# Altium schematic sheet Controller-Sheet.SchDoc
size A4; SheetNumber: 4; SheetTotal: 10
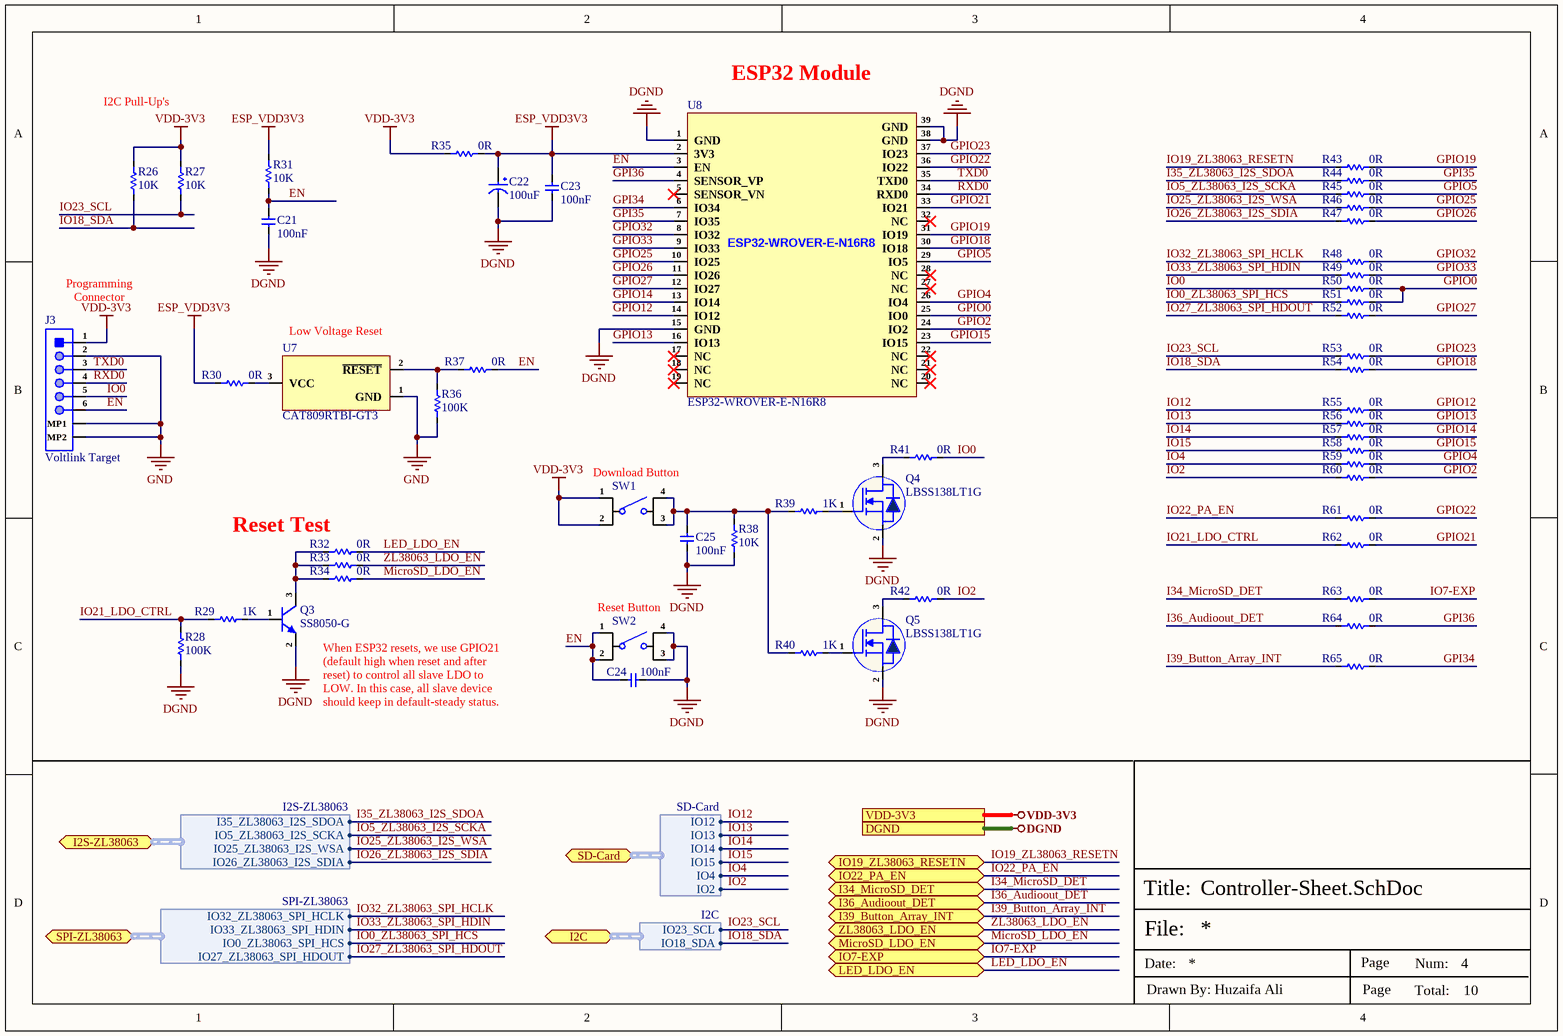
[diagram p0: Controller-Sheet.SchDoc]

## Parts
C21  100nF  [Cap-0402]
C22  100uF  [Case-E]
C23  100nF  [Cap-0402]
C24  100nF  [Cap-0402]
C25  100nF  [Cap-0402]
J3  Voltlink Target  [Voltlink Target]
Q3  SS8050-G  [SOT-23]
Q4  LBSS138LT1G  [SOT-23]
Q5  LBSS138LT1G  [SOT-23]
R26  10K  [Res-0402]
R27  10K  [Res-0402]
R28  100K  [Res-0402]
R29  1K  [Res-0402]
R30  0R  [Res-0201]
R31  10K  [Res-0402]
R32  0R  [Res-0201]
R33  0R  [Res-0201]
R34  0R  [Res-0201]
R35  0R  [Res-0603]
R36  100K  [Res-0402]
R37  0R  [Res-0201]
R38  10K  [Res-0402]
R39  1K  [Res-0402]
R40  1K  [Res-0402]
R41  0R  [Res-0201]
R42  0R  [Res-0201]
R43  0R  [Res-0201]
R44  0R  [Res-0201]
R45  0R  [Res-0201]
R46  0R  [Res-0201]
R47  0R  [Res-0201]
R48  0R  [Res-0201]
R49  0R  [Res-0201]
R50  0R  [Res-0201]
R51  0R  [Res-0201]
R52  0R  [Res-0201]
R53  0R  [Res-0201]
R54  0R  [Res-0201]
R55  0R  [Res-0201]
R56  0R  [Res-0201]
R57  0R  [Res-0201]
R58  0R  [Res-0201]
R59  0R  [Res-0201]
R60  0R  [Res-0201]
R61  0R  [Res-0201]
R62  0R  [Res-0201]
R63  0R  [Res-0201]
R64  0R  [Res-0201]
R65  0R  [Res-0201]
SW1  TS-1109S-C-B  [TS-1109S-C-B]  (value not drawn)
SW2  TS-1109S-C-B  [TS-1109S-C-B]  (value not drawn)
U7  CAT809RTBI-GT3  [SOT-23]
U8  ESP32-WROVER-E-N16R8  [ESP32-WROVER-E-N16R8]

## Ports
DGND (see Top-Sheet[2A], Buttons-LED-Sheet[3D], MICs-Sheet[3D], Power-Sheet[2D], SD-Card-Sheet[3D]), I2C (bidir, harness I2C, see Top-Sheet[3C], Buttons-LED-Sheet[2D]), I2S-ZL38063 (bidir, harness I2S-ZL38063, see Top-Sheet[3A], DSP-Sheet-2[1D]), I34_MicroSD_DET (bidir, see Top-Sheet[2C], SD-Card-Sheet[2D]), I36_Audioout_DET (bidir, see Top-Sheet[3B], Amplifier-Sheet[2D]), I39_Button_Array_INT (bidir, see Top-Sheet[3C], Buttons-LED-Sheet[2D]), IO7-EXP (bidir, see Top-Sheet[3C], Buttons-LED-Sheet[2D]), IO19_ZL38063_RESETN (bidir, see Top-Sheet[3A], DSP-Sheet-2[2D]), IO22_PA_EN (bidir, see Top-Sheet[3B], Amplifier-Sheet[2D]), LED_LDO_EN (bidir, see Top-Sheet[3C], Buttons-LED-Sheet[2D]), MicroSD_LDO_EN (bidir, see Top-Sheet[2B], Power-Sheet[1D]), SD-Card (bidir, harness SD-Card, see Top-Sheet[2C], SD-Card-Sheet[1D]), SPI-ZL38063 (bidir, harness SPI-ZL38063, see Top-Sheet[3A], DSP-Sheet-2[1D]), VDD-3V3 (see Top-Sheet[2A], Buttons-LED-Sheet[3D], Power-Sheet[2D]), ZL38063_LDO_EN (bidir, see Top-Sheet[2B], Power-Sheet[1D])

## Harnesses
I2S-ZL38063: I35_ZL38063_I2S_SDOA, IO5_ZL38063_I2S_SCKA, IO25_ZL38063_I2S_WSA, IO26_ZL38063_I2S_SDIA
SPI-ZL38063: IO32_ZL38063_SPI_HCLK, IO33_ZL38063_SPI_HDIN, IO0_ZL38063_SPI_HCS, IO27_ZL38063_SPI_HDOUT
I2C: IO23_SCL, IO18_SDA
SD-Card: IO12, IO13, IO14, IO15, IO4, IO2

## Nets
DGND: C21.1 C22.2 C23.1 C24.1 C25.1 Q3.2(E) Q4.2(S) Q5.2(S) R28.1 R38.1 SW2.3 SW2.4 U8.1(GND) U8.15(GND) U8.38(GND) U8.39(GND) ; port DGND
ESP_VDD3V3: C22.1 C23.2 R30.1 R31.2 R35.2 U8.2(3V3)
GND: J3.2 J3.MP1 J3.MP2 R36.1 U7.1(GND)
VDD-3V3: J3.1 R26.2 R27.2 R35.1 SW1.1 SW1.2 ; port VDD-3V3
EN: C21.2 C24.2 J3.6 R31.1 R37.2 SW2.1 SW2.2 U8.3(EN)
GPI34: R65.2 U8.6(IO34)
GPI35: R44.2 U8.7(IO35)
GPI36: R64.2 U8.4(SENSOR_VP)
GPIO0: R50.2 R51.2 U8.25(IO0)
GPIO2: R60.2 U8.24(IO2)
GPIO4: R59.2 U8.26(IO4)
GPIO5: R45.2 U8.29(IO5)
GPIO12: R55.2 U8.14(IO12)
GPIO13: R56.2 U8.16(IO13)
GPIO14: R57.2 U8.13(IO14)
GPIO15: R58.2 U8.23(IO15)
GPIO18: R54.2 U8.30(IO18)
GPIO19: R43.2 U8.31(IO19)
GPIO21: R62.2 U8.33(IO21)
GPIO22: R61.2 U8.36(IO22)
GPIO23: R53.2 U8.37(IO23)
GPIO25: R46.2 U8.10(IO25)
GPIO26: R47.2 U8.11(IO26)
GPIO27: R52.2 U8.12(IO27)
GPIO32: R48.2 U8.8(IO32)
GPIO33: R49.2 U8.9(IO33)
I34_MicroSD_DET: R63.1 ; port I34_MicroSD_DET
I35_ZL38063_I2S_SDOA: R44.1 ; port I2S-ZL38063.I35_ZL38063_I2S_SDOA
I36_Audioout_DET: R64.1 ; port I36_Audioout_DET
I39_Button_Array_INT: R65.1 ; port I39_Button_Array_INT
IO0: J3.5 R41.2 R50.1
IO0_ZL38063_SPI_HCS: R51.1 ; port SPI-ZL38063.IO0_ZL38063_SPI_HCS
IO2: R42.2 R60.1 ; port SD-Card.IO2
IO4: R59.1 ; port SD-Card.IO4
IO5_ZL38063_I2S_SCKA: R45.1 ; port I2S-ZL38063.IO5_ZL38063_I2S_SCKA
IO7-EXP: R63.2 ; port IO7-EXP
IO12: R55.1 ; port SD-Card.IO12
IO13: R56.1 ; port SD-Card.IO13
IO14: R57.1 ; port SD-Card.IO14
IO15: R58.1 ; port SD-Card.IO15
IO18_SDA: R26.1 R54.1 ; port I2C.IO18_SDA
IO19_ZL38063_RESETN: R43.1 ; port IO19_ZL38063_RESETN
IO21_LDO_CTRL: R28.2 R29.2 R62.1
IO22_PA_EN: R61.1 ; port IO22_PA_EN
IO23_SCL: R27.1 R53.1 ; port I2C.IO23_SCL
IO25_ZL38063_I2S_WSA: R46.1 ; port I2S-ZL38063.IO25_ZL38063_I2S_WSA
IO26_ZL38063_I2S_SDIA: R47.1 ; port I2S-ZL38063.IO26_ZL38063_I2S_SDIA
IO27_ZL38063_SPI_HDOUT: R52.1 ; port SPI-ZL38063.IO27_ZL38063_SPI_HDOUT
IO32_ZL38063_SPI_HCLK: R48.1 ; port SPI-ZL38063.IO32_ZL38063_SPI_HCLK
IO33_ZL38063_SPI_HDIN: R49.1 ; port SPI-ZL38063.IO33_ZL38063_SPI_HDIN
LED_LDO_EN: R32.2 ; port LED_LDO_EN
MicroSD_LDO_EN: R34.2 ; port MicroSD_LDO_EN
RXD0: J3.4 U8.34(RXD0)
TXD0: J3.3 U8.35(TXD0)
ZL38063_LDO_EN: R33.2 ; port ZL38063_LDO_EN
NetC25_2: C25.2 R38.2 R39.2 R40.2 SW1.3 SW1.4
NetQ3_1: Q3.1(B) R29.1
NetQ3_3: Q3.3(C) R32.1 R33.1 R34.1
NetQ4_1: Q4.1(G) R39.1
NetQ4_3: Q4.3(D) R41.1
NetQ5_1: Q5.1(G) R40.1
NetQ5_3: Q5.3(D) R42.1
NetR30_2: R30.2 U7.3(VCC)
NetR36_2: R36.2 R37.1 U7.2(~{RESET})

Not connected (* = marked no-connect by the designer): U8 5(SENSOR_VN)* 17(NC)* 18(NC)* 19(NC)* 20(NC)* 21(NC)* 22(NC)* 27(NC)* 28(NC)* 32(NC)*

## Notes on the sheet
- I2C Pull-Up's
- (near U8) ESP32 Module
- (near J3) Programming Connector
- (near U7) Low Voltage Reset
- (near R32) Reset Test
- (near SW1) Download Button
- (near SW2) Reset Button
- (near Q3) When ESP32 resets, we use GPIO21 (default high when reset and after reset) to control all slave LDO to LOW. In this case, all slave device should keep in default-steady status.
- File:
- Title:
- Date:
- Page
- Num:
- Total:
- Drawn By: Huzaifa Ali

## Library data of the parts
C21 C23-C25 = CC0402KRX5R7BB104: CAP CER 0.1UF 16V X5R 0402; Manufacturer: Yageo; Tolerance: 10%; Supplier 1: Mouser; Manufacturer Part Number: CC0402KRX5R7BB104; RoHS: Yes; Category: Ceramic Capacitors; Stock 1: 936792; Pricing 1: 1=0.10000, 10=0.02300, 50=0.02300, 100=0.01100, 1000=0.00600, 10000=0.00400 (USD); Mount: Surface Mount; Case/Package: 0402; Number of Pins: 2; Case Code (Metric): 1005; Case Code (Imperial): 0402; Min Operating Temperature: -55°C; Max Operating Temperature: 85°C; Capacitance: 100nF; Dielectric: X5R; Packaging: Tape and Reel; Voltage Rating: 16V; Package Quantity: 1; Voltage Rating (DC): 16V; Termination: SMD/SMT; Resistor Type: Ceramic; Series: CC; Construction: Flat; Length: 1mm; Width: 0.02inch; Height: 0.5mm; Thickness: 0.022inch; Depth: 0.5mm; Radiation Hardening: No; REACH SVHC: Unknown; Lead Free: Lead Free; Halogen Free: Halogen Free; RoHS Compliant: Yes; ComponentLink1URL: https://datasheet.ciiva.com/155/mlccorderingcode-155879.pdf?src-supplier=Digi-Key; ComponentLink1Description: https://datasheet.ciiva.com/155/mlccorderingcode-155879.pdf?src-supplier=Digi-Key; ComponentLink2URL: https://datasheet.ciiva.com/155/mlccorderingcode-155878.pdf?src-supplier=Digi-Key; ComponentLink2Description: https://datasheet.ciiva.com/155/mlccorderingcode-155878.pdf?src-supplier=Digi-Key; ComponentLink3URL: https://datasheet.ciiva.com/155/mlccorderingcode-155880.pdf?src-supplier=Digi-Key; ComponentLink3Description: https://datasheet.ciiva.com/155/mlccorderingcode-155880.pdf?src-supplier=Digi-Key; ComponentLink4URL: https://datasheet.ciiva.com/11464/upy-gphc-x5r-4v-to-50v-12-11464869.pdf?src-supplier=Avnet; ComponentLink4Description: https://datasheet.ciiva.com/11464/upy-gphc-x5r-4v-to-50v-12-11464869.pdf?src-supplier=Avnet; Supplier Part Number 1: 603-CC402KRX5R7BB104; LCSC Part Number: C106204
C22 = TAJE107M025RNJ: CAP TANT 100UF 20% 25V 2917; Manufacturer: Kyocera AVX; ESR (Equivalent Series Resistance): 300mR; Leakage Current: 25uA; Polarity: Polar; Dissipation Factor: 10%; Supplier 1: Mouser; Manufacturer Part Number: TAJE107M025RNJ; RoHS: Yes; Category: Tantalum Capacitors; Stock 1: 109; Pricing 1: 1=2.81000, 10=2.81000, 50=2.81000, 100=2.19000, 1000=1.76000, 10000=1.76000 (USD); Mount: Surface Mount; Case/Package: 2917; Number of Pins: 2; Case Code (Imperial): 2917; Case Code (Metric): 7343; Min Operating Temperature: -55°C; Max Operating Temperature: 125°C; Capacitance: 100uF; Tolerance: 20%; Packaging: Tape and Reel; Voltage Rating: 25V; Voltage Rating (DC): 25V; Features: General Purpose; Package Quantity: 1; Termination: SMD/SMT; Series: TAJ; Construction: Flat; Length: 7.3mm; Width: 4.3mm; Height: 4.3mm; Depth: 4.3mm; Height - Seated (Max): 0.169inch; Radiation Hardening: No; Lead Free: Lead Free; RoHS Compliant: Yes; REACH SVHC: No SVHC; ComponentLink1URL: https://datasheet.ciiva.com/26787/taje107m025rnj-26787048.pdf?src-supplier=IIIC; ComponentLink1Description: https://datasheet.ciiva.com/26787/taje107m025rnj-26787048.pdf?src-supplier=IIIC; ComponentLink2URL: https://datasheet.ciiva.com/265/taj-265541.pdf?src-supplier=Digi-Key; ComponentLink2Description: https://datasheet.ciiva.com/265/taj-265541.pdf?src-supplier=Digi-Key; ComponentLink3URL: https://datasheet.ciiva.com/265/taj-265542.pdf?src-supplier=Digi-Key; ComponentLink3Description: https://datasheet.ciiva.com/265/taj-265542.pdf?src-supplier=Digi-Key; ComponentLink4URL: https://datasheet.ciiva.com/265/taj-265540.pdf?src-supplier=Digi-Key; ComponentLink4Description: https://datasheet.ciiva.com/265/taj-265540.pdf?src-supplier=Digi-Key; ComponentLink5URL: https://datasheet.ciiva.com/28609/1719052-28609254.pdf?src-supplier=Element14; ComponentLink5Description: https://datasheet.ciiva.com/28609/1719052-28609254.pdf?src-supplier=Element14; ComponentLink6URL: https://datasheet.ciiva.com/11230/taj-11230456.pdf?src-supplier=Avnet; ComponentLink6Description: https://datasheet.ciiva.com/11230/taj-11230456.pdf?src-supplier=Avnet; ComponentLink7URL: https://datasheet.ciiva.com/17339/taj-17339677.pdf?src-supplier=Avnet+Europe; ComponentLink7Description: https://datasheet.ciiva.com/17339/taj-17339677.pdf?src-supplier=Avnet+Europe; ComponentLink8URL: https://datasheet.ciiva.com/22667/1719052-22667581.pdf?src-supplier=Element14; ComponentLink8Description: https://datasheet.ciiva.com/22667/1719052-22667581.pdf?src-supplier=Element14; Supplier Part Number 1: 581-TAJE107M025RNJ; LCSC Part Number: C7230
J3 = C145963: 1x6P SH 1 1mm 6 SMD,P=1mm Wire To Board / Wire To Wire Connector ROHS; Manufacturer: BOOMELE; Manufacturer Part Number: C145963; Package: SMD,P=1mm; LCSC Part Number: C145963; Item Type: Connector; ComponentLink1Description: LCSC; ComponentLink1URL: https://www.lcsc.com/product-detail/Wire-To-Board-Wire-To-Wire-Connector_BOOMELE-Boom-Precision-Elec-C145963_C145963.html
Q3 = SS8050-G: 25V 300mW 120@100mA,1V 1.5A NPN SOT-23 Bipolar Transistors - BJT ROHS; Manufacturer: Jiangsu Changjing Electronics Technology; Manufacturer Part Number: SS8050-G; Package: SOT-23; LCSC Part Number: C164886; Itype Type: Transistor; ComponentLink1Description: LCSC; ComponentLink1URL: https://www.lcsc.com/product-detail/Bipolar-Transistors-BJT_Jiangsu-Changjing-Electronics-Technology-Co-Ltd-SS8050-G_C164886.html
Q4 Q5 = LBSS138LT1G: 50V 0.2A 225mW 3.5Ω@5V,200mA N Channel SOT-23 MOSFETs ROHS; Manufacturer: LRC; Item Type: Mosfet; Manufacturer Part Number: LBSS138LT1G; Package: SOT-23; LCSC Part Number: C8490; ComponentLink1Description: LCSC; ComponentLink1URL: https://www.lcsc.com/product-detail/MOSFETs_LRC-LBSS138LT1G_C8490.html
R26 R27 R31 R38 = RC0402FR-0710KL: RES 10K OHM 1% 1/16W 0402; Manufacturer: Yageo; Resistance: 10kR; Voltage Rating (DC): 50V; Temperature Coefficient: 100ppm/°C; Power Rating: 62.5mW; Max Power Dissipation: 63mW; Item Type: Resistor; Supplier 1: Mouser; Manufacturer Part Number: RC0402FR-0710KL; RoHS: Yes; Category: Chip SMD Resistors; Stock 1: 18648329; Pricing 1: 1=0.10000, 10=0.01400, 50=0.01400, 100=0.00500, 1000=0.00300, 10000=0.00200 (USD); Case/Package: 0402; Number of Pins: 2; Case Code (Imperial): 0402; Case Code (Metric): 1005; Min Operating Temperature: -55°C; Max Operating Temperature: 155°C; Resistor Type: Thick Film; Tolerance: 1%; Packaging: Tape and Reel; Voltage Rating: 50V; Termination: SMD/SMT; Working Voltage: 50V; Number of Terminations: 2; Features: Moisture Resistant; Series: RC; Resistance Tolerance: 1%; Construction: Rectangular; Length: 1mm; Width: 0.5mm; Height: 0.32mm; Depth: 0.5mm; Lead Pitch: 0.2mm; REACH SVHC: No SVHC; Lead Free: Lead Free; RoHS Compliant: Yes; Military Standard: Not; ComponentLink1URL: https://datasheet.ciiva.com/7660/38568-7660787.pdf?src-supplier=Element14; ComponentLink1Description: https://datasheet.ciiva.com/7660/38568-7660787.pdf?src-supplier=Element14; ComponentLink2URL: https://datasheet.ciiva.com/7849/1686128-7849814.pdf?src-supplier=Element14; ComponentLink2Description: https://datasheet.ciiva.com/7849/1686128-7849814.pdf?src-supplier=Element14; ComponentLink3URL: https://datasheet.ciiva.com/7983/1018594-7983486.pdf?src-supplier=Element14; ComponentLink3Description: https://datasheet.ciiva.com/7983/1018594-7983486.pdf?src-supplier=Element14; ComponentLink4URL: https://datasheet.ciiva.com/22747/1018594-22747512.pdf?src-supplier=Element14; ComponentLink4Description: https://datasheet.ciiva.com/22747/1018594-22747512.pdf?src-supplier=Element14; ComponentLink5URL: https://datasheet.ciiva.com/12667/pyu-rc0402-51-rohs-l-6-r-12667067.pdf?src-supplier=Mouser; ComponentLink5Description: https://datasheet.ciiva.com/12667/pyu-rc0402-51-rohs-l-6-r-12667067.pdf?src-supplier=Mouser; ComponentLink6URL: https://datasheet.ciiva.com/7849/1784430-7849813.pdf?src-supplier=Element14; ComponentLink6Description: https://datasheet.ciiva.com/7849/1784430-7849813.pdf?src-supplier=Element14; ComponentLink7URL: https://datasheet.ciiva.com/7849/1784430-7849815.pdf?src-supplier=Element14; ComponentLink7Description: https://datasheet.ciiva.com/7849/1784430-7849815.pdf?src-supplier=Element14; Supplier Part Number 1: 603-RC0402FR-0710KL; LCSC Part Number: C60490
R28 R36 = RC0402FR-07100KL: RES 100K OHM 1% 1/16W 0402; Manufacturer: Yageo; Resistance: 100kR; Temperature Coefficient: 100ppm/°C; Power Rating: 63mW; Voltage Rating: 50V; Item Type: Resistor; Supplier 1: Mouser; Manufacturer Part Number: RC0402FR-07100KL; RoHS: Yes; Category: Chip SMD Resistors; Stock 1: 7759549; Pricing 1: 1=0.10000, 10=0.01200, 50=0.01200, 100=0.00500, 1000=0.00300, 2500=0.00200, 10000=0.00100 (USD); Case/Package: 0402; Case Code (Metric): 1005; Case Code (Imperial): 0402; Min Operating Temperature: -55°C; Max Operating Temperature: 155°C; Resistor Type: Thick Film; Tolerance: 1%; Packaging: Tape and Reel; Package Quantity: 1; Number of Terminations: 2; Termination: SMD/SMT; Max Power Dissipation: 63mW; Working Voltage: 50V; Features: Moisture Resistant; Series: RC; Resistance Tolerance: 1%; Construction: Rectangular; Technology: THICK FILM; Length: 0.039inch; Width: 0.02inch; Height: 0.016inch; Depth: 0.5mm; REACH SVHC: No SVHC; Lead Free: Lead Free; RoHS Compliant: Yes; Military Standard: Not; ComponentLink1URL: https://datasheet.ciiva.com/11819/0900766b80c66297-11819452.pdf?src-supplier=RSComponents; ComponentLink1Description: https://datasheet.ciiva.com/11819/0900766b80c66297-11819452.pdf?src-supplier=RSComponents; ComponentLink2URL: https://datasheet.ciiva.com/22747/1018594-22747509.pdf?src-supplier=Element14; ComponentLink2Description: https://datasheet.ciiva.com/22747/1018594-22747509.pdf?src-supplier=Element14; ComponentLink3URL: https://datasheet.ciiva.com/2453/pyu-r-int-thick-7-2453362.pdf?src-supplier=Digi-Key; ComponentLink3Description: https://datasheet.ciiva.com/2453/pyu-r-int-thick-7-2453362.pdf?src-supplier=Digi-Key; ComponentLink4URL: https://datasheet.ciiva.com/2453/pyu-r-int-thick-7-2453363.pdf?src-supplier=Digi-Key; ComponentLink4Description: https://datasheet.ciiva.com/2453/pyu-r-int-thick-7-2453363.pdf?src-supplier=Digi-Key; ComponentLink5URL: https://datasheet.ciiva.com/2453/pyu-r-int-thick-7-2453361.pdf?src-supplier=Digi-Key; ComponentLink5Description: https://datasheet.ciiva.com/2453/pyu-r-int-thick-7-2453361.pdf?src-supplier=Digi-Key; ComponentLink6URL: https://datasheet.ciiva.com/12667/pyu-rc0402-51-rohs-l-6-r-12667930.pdf?src-supplier=Mouser; ComponentLink6Description: https://datasheet.ciiva.com/12667/pyu-rc0402-51-rohs-l-6-r-12667930.pdf?src-supplier=Mouser; ComponentLink7URL: https://datasheet.ciiva.com/15189/getdatasheetpartid-323696-15189334.pdf?src-supplier=Verical; ComponentLink7Description: https://datasheet.ciiva.com/15189/getdatasheetpartid-323696-15189334.pdf?src-supplier=Verical; Supplier Part Number 1: 603-RC0402FR-07100KL; LCSC Part Number: C60491
R29 R39 R40 = RC0402FR-071KL: RES 1K OHM 1% 1/16W 0402; Manufacturer: Yageo; Resistance: 1kR; Temperature Coefficient: 100ppm/°C; Voltage Rating (DC): 50V; Power Rating: 62.5mW; Max Power Dissipation: 63mW; Item Type: Resistor; Supplier 1: Avnet; Manufacturer Part Number: RC0402FR-071KL; RoHS: Yes; Category: Chip SMD Resistors; Stock 1: 13030000; Pricing 1: 10000=0.00085, 20000=0.00087, 40000=0.00084, 60000=0.00083, 80000=0.00079, 100000=0.00078, 1000000=0.00076 (USD); Case/Package: 0402; Number of Pins: 2; Case Code (Imperial): 0402; Case Code (Metric): 1005; Size Code: 0402; Min Operating Temperature: -55°C; Max Operating Temperature: 155°C; Resistor Type: Thick Film; Tolerance: 1%; Packaging: Tape and Reel; Voltage Rating: 50V; Termination: SMD/SMT; Features: Moisture Resistant; Series: RC; Number of Terminations: 2; Resistance Tolerance: 1%; Construction: Rectangular; Technology: THICK FILM; Length: 1mm; Width: 0.5mm; Height: 0.32mm; Depth: 0.5mm; Reach SVHC Compliant: Yes; Lead Free: Lead Free; RoHS Compliant: Yes; Military Standard: Not; ComponentLink1URL: https://datasheet.ciiva.com/11819/0900766b80c66297-11819477.pdf?src-supplier=RSComponents; ComponentLink1Description: https://datasheet.ciiva.com/11819/0900766b80c66297-11819477.pdf?src-supplier=RSComponents; ComponentLink2URL: https://datasheet.ciiva.com/7983/1018594-7983502.pdf?src-supplier=Element14; ComponentLink2Description: https://datasheet.ciiva.com/7983/1018594-7983502.pdf?src-supplier=Element14; ComponentLink3URL: https://datasheet.ciiva.com/22747/1018594-22747513.pdf?src-supplier=Element14; ComponentLink3Description: https://datasheet.ciiva.com/22747/1018594-22747513.pdf?src-supplier=Element14; ComponentLink4URL: https://datasheet.ciiva.com/12666/pyu-rc0402-51-rohs-l-6-r-12666741.pdf?src-supplier=Mouser; ComponentLink4Description: https://datasheet.ciiva.com/12666/pyu-rc0402-51-rohs-l-6-r-12666741.pdf?src-supplier=Mouser; ComponentLink5URL: https://datasheet.ciiva.com/7849/1018594-7849869.pdf?src-supplier=Element14; ComponentLink5Description: https://datasheet.ciiva.com/7849/1018594-7849869.pdf?src-supplier=Element14; ComponentLink6URL: https://datasheet.ciiva.com/7849/1018594-7849871.pdf?src-supplier=Element14; ComponentLink6Description: https://datasheet.ciiva.com/7849/1018594-7849871.pdf?src-supplier=Element14; ComponentLink7URL: https://datasheet.ciiva.com/17063/pyu-rc0402-51-rohs-l-6-r-17063193.pdf?src-supplier=Future+Electronics; ComponentLink7Description: https://datasheet.ciiva.com/17063/pyu-rc0402-51-rohs-l-6-r-17063193.pdf?src-supplier=Future+Electronics; Supplier Part Number 1: RC0402FR-071KL; LCSC Part Number: C106235
R30 R32-R34 R37 R41-R65 = RC0201JR-070RL: RES SMD 0 OHM JUMPER 1/20W 0201; Manufacturer: Yageo; Power Rating: 50mW; Tolerance: 5%; Voltage Rating: 25V; Supplier 1: Digi-Key; Manufacturer Part Number: RC0201JR-070RL; RoHS: Yes; Category: Chip SMD Resistors; Stock 1: 11079; Pricing 1: 1=0.10000, 10=0.03600, 25=0.02640, 50=0.02000, 100=0.01480, 250=0.01128, 500=0.00904, 1000=0.00665, 5000=0.00477 (USD); Case/Package: 0201; Contact Plating: Tin,Matte; Case Code (Metric): 0603; Case Code (Imperial): 0201; Weight: 6E-06oz; Size Code: 0201; Min Operating Temperature: -55°C; Max Operating Temperature: 125°C; Resistor Type: Thick Film; Resistance: 0R; Packaging: Tape and Reel; Package Quantity: 10000; Number of Terminations: 2; Termination: SMD/SMT; Max Power Dissipation: 50mW; Voltage Rating (DC): 25V; Features: Moisture Resistant; Series: RC; Construction: Rectangular; Resistance Tolerance: 5%; Length: 0.6mm; Width: 0.012inch; Height: 0.01inch; Depth: 0.3mm; Radiation Hardening: No; RoHS Compliant: Yes; REACH SVHC: Unknown; Military Standard: Not; Lead Free: Lead Free; ComponentLink1URL: https://datasheet.ciiva.com/7672/1563626-7672247.pdf?src-supplier=Element14; ComponentLink1Description: https://datasheet.ciiva.com/7672/1563626-7672247.pdf?src-supplier=Element14; ComponentLink2URL: https://datasheet.ciiva.com/7660/1421516-7660808.pdf?src-supplier=Element14; ComponentLink2Description: https://datasheet.ciiva.com/7660/1421516-7660808.pdf?src-supplier=Element14; ComponentLink3URL: https://datasheet.ciiva.com/7672/1563626-7672248.pdf?src-supplier=Element14; ComponentLink3Description: https://datasheet.ciiva.com/7672/1563626-7672248.pdf?src-supplier=Element14; ComponentLink4URL: https://datasheet.ciiva.com/16855/pyu-rc0201-51-rohs-l-8-16855994.pdf?src-supplier=Avnet+Europe; ComponentLink4Description: https://datasheet.ciiva.com/16855/pyu-rc0201-51-rohs-l-8-16855994.pdf?src-supplier=Avnet+Europe; ComponentLink5URL: https://datasheet.ciiva.com/28419/pyu-rc0201-51-rohs-l-8-28419660.pdf?src-supplier=Avnet+Europe; ComponentLink5Description: https://datasheet.ciiva.com/28419/pyu-rc0201-51-rohs-l-8-28419660.pdf?src-supplier=Avnet+Europe; ComponentLink6URL: https://datasheet.ciiva.com/46391/1421516-46391340.pdf?src-supplier=Element14; ComponentLink6Description: https://datasheet.ciiva.com/46391/1421516-46391340.pdf?src-supplier=Element14; ComponentLink7URL: https://datasheet.ciiva.com/8896/pyu-rc0201-51-rohs-l-8-8896143.pdf?src-supplier=Avnet; ComponentLink7Description: https://datasheet.ciiva.com/8896/pyu-rc0201-51-rohs-l-8-8896143.pdf?src-supplier=Avnet; Supplier Part Number 1: 311-0.0NCT-ND; LCSC Part Number: C106228
R35 = RC0603JR-070RL: RES 0 OHM JUMPER 1/10W 0603; Manufacturer: Yageo; Resistance: 0mR; Tolerance: 1%; Power Rating: 100mW; Voltage Rating (DC): 50V; Temperature Coefficient: 200ppm/°C; Resistance Tolerance: 5%; Item Type: Resistor; Supplier 1: Digi-Key; Manufacturer Part Number: RC0603JR-070RL; RoHS: Yes; Category: Chip SMD Resistors; Stock 1: 18081776; Pricing 1: 1=0.10000, 10=0.01700, 25=0.01240, 50=0.00960, 100=0.00700, 250=0.00536, 500=0.00430, 1000=0.00316 (USD); Case/Package: 0603; Number of Pins: 2; Contact Plating: Tin,Matte; Case Code (Imperial): 0603; Case Code (Metric): 1608; Size Code: 0603; Min Operating Temperature: -55°C; Max Operating Temperature: 155°C; Resistor Type: Thick Film; Packaging: Tape and Reel; Termination: SMD/SMT; Series: RC; Technology: THICK FILM; Package Quantity: 5000; Voltage Rating: 50V; Features: Moisture Resistant; Max Power Dissipation: 100mW; Number of Terminations: 2; Construction: Rectangular; Length: 1.6mm; Width: 0.8mm; Height: 0.45mm; Depth: 0.8mm; Radiation Hardening: No; Reach SVHC Compliant: No SVHC; Lead Free: Lead Free; RoHS Compliant: Yes; Military Standard: Not; Supplier Part Number 1: 311-0.0GRCT-ND; LCSC Part Number: C95177
SW1 SW2 = TS-1109S-C-B: No NO 50mA 4.5mm 100000 260gf 12V -30℃~+85℃ 4.5mm 4.3mm Black Round Button Brick nogging SPST SMD Tactile Switches ROHS; Manufacturer: XKB Connectivity; Item Type: Switch; Manufacturer Part Number: TS-1109S-C-B; Package: Custom; LCSC Part Number: C381037; ComponentLink1Description: LCSC; ComponentLink1URL: https://www.lcsc.com/product-detail/Tactile-Switches_XKB-Connectivity-TS-1109S-C-B_C381037.html
U7 = CAT809RTBI-GT3: IC SUPERVISOR 1 CHANNEL SOT23-3; Manufacturer: ON Semiconductor; Min Supply Voltage: 1.2V; Max Supply Voltage: 5.5V; Max Power Dissipation: 320mW; Number of Voltages Monitored: 1; Reset: Active Low; Reset Timeout: 140ms; Threshold Voltage: 2.63V; Overvoltage Threshold: 2.66V; Undervoltage Threshold: 2.59V; Operating Supply Current: 15uA; Watchdog Timer: No; Output: TOTEM-POLE; Supplier: Avnet; Supplier Part Number: CAT809RTBI-GT3; Manufacturer Part Number: CAT809RTBI-GT3; RoHS: Yes; Category: Voltage Supervisors; Stock: 9000; Pricing: 1751=0.21134, 1800=0.20563, 3600=0.19992, 8800=0.19421, 18000=0.1885, 88000=0.18278, 180000=0.17707 (USD); Mounting Technology: Surface Mount; Case/Package: SOT-23; Pins: 3; Min Operating Temperature: -40°C; Max Operating Temperature: 85°C; Packaging: Tape and Reel; Package Quantity: 1; Type: Simple Reset/Power-On Reset; Number of Elements: 1; Power Dissipation: 320mW; Max Reset Threshold Voltage: 2.66V; Min Reset Threshold Voltage: 2.59V; Series: -; Supply Current: 15uA; Length: 3.04mm; Width: 1.4mm; Height: 1.12mm; Radiation Hardening: No; Lead Free: Lead Free; Halogen Free: Halogen Free; RoHS Compliant: Yes; ComponentLink1URL: https://datasheet.ciiva.com/15106/getdatasheetpartid-292712-15106066.pdf?src-supplier=Verical; ComponentLink1Description: https://datasheet.ciiva.com/15106/getdatasheetpartid-292712-15106066.pdf?src-supplier=Verical; ComponentLink2URL: https://datasheet.ciiva.com/4902/cat809-d-221891-4902492.pdf?src-supplier=Mouser; ComponentLink2Description: https://datasheet.ciiva.com/4902/cat809-d-221891-4902492.pdf?src-supplier=Mouser; ComponentLink3URL: https://datasheet.ciiva.com/8138/cat803-d-8138454.pdf?src-supplier=Avnet; ComponentLink3Description: https://datasheet.ciiva.com/8138/cat803-d-8138454.pdf?src-supplier=Avnet; ComponentLink4URL: https://datasheet.ciiva.com/16428/cat809-d-16428022.pdf?src-supplier=Future+Electronics; ComponentLink4Description: https://datasheet.ciiva.com/16428/cat809-d-16428022.pdf?src-supplier=Future+Electronics; LCSC Part Number: C43445; Item Type: IC
U8 = ESP32-WROVER-E-N16R8: RF TXRX MODULE BT PCB TRACE SMD; Manufacturer: Espressif Systems; Supplier: Digi-Key; Supplier Part Number: 1965-ESP32-WROVER-E-N16R8CT-ND; Manufacturer Part Number: ESP32-WROVER-E-N16R8; RoHS: No; Category: Uncategorized; Stock: 11720; Pricing: 1=3.28 (USD); LCSC Part Number: C529589; Item Type: Module